# Altium project GTV4.0_Board.PrjPcb (part 5 of 11)

## Sheet Onboard_Sensor_Section.SchDoc
size 420 x 297 mm; DocumentNumber: 17; SheetNumber: 17; SheetTotal: 17
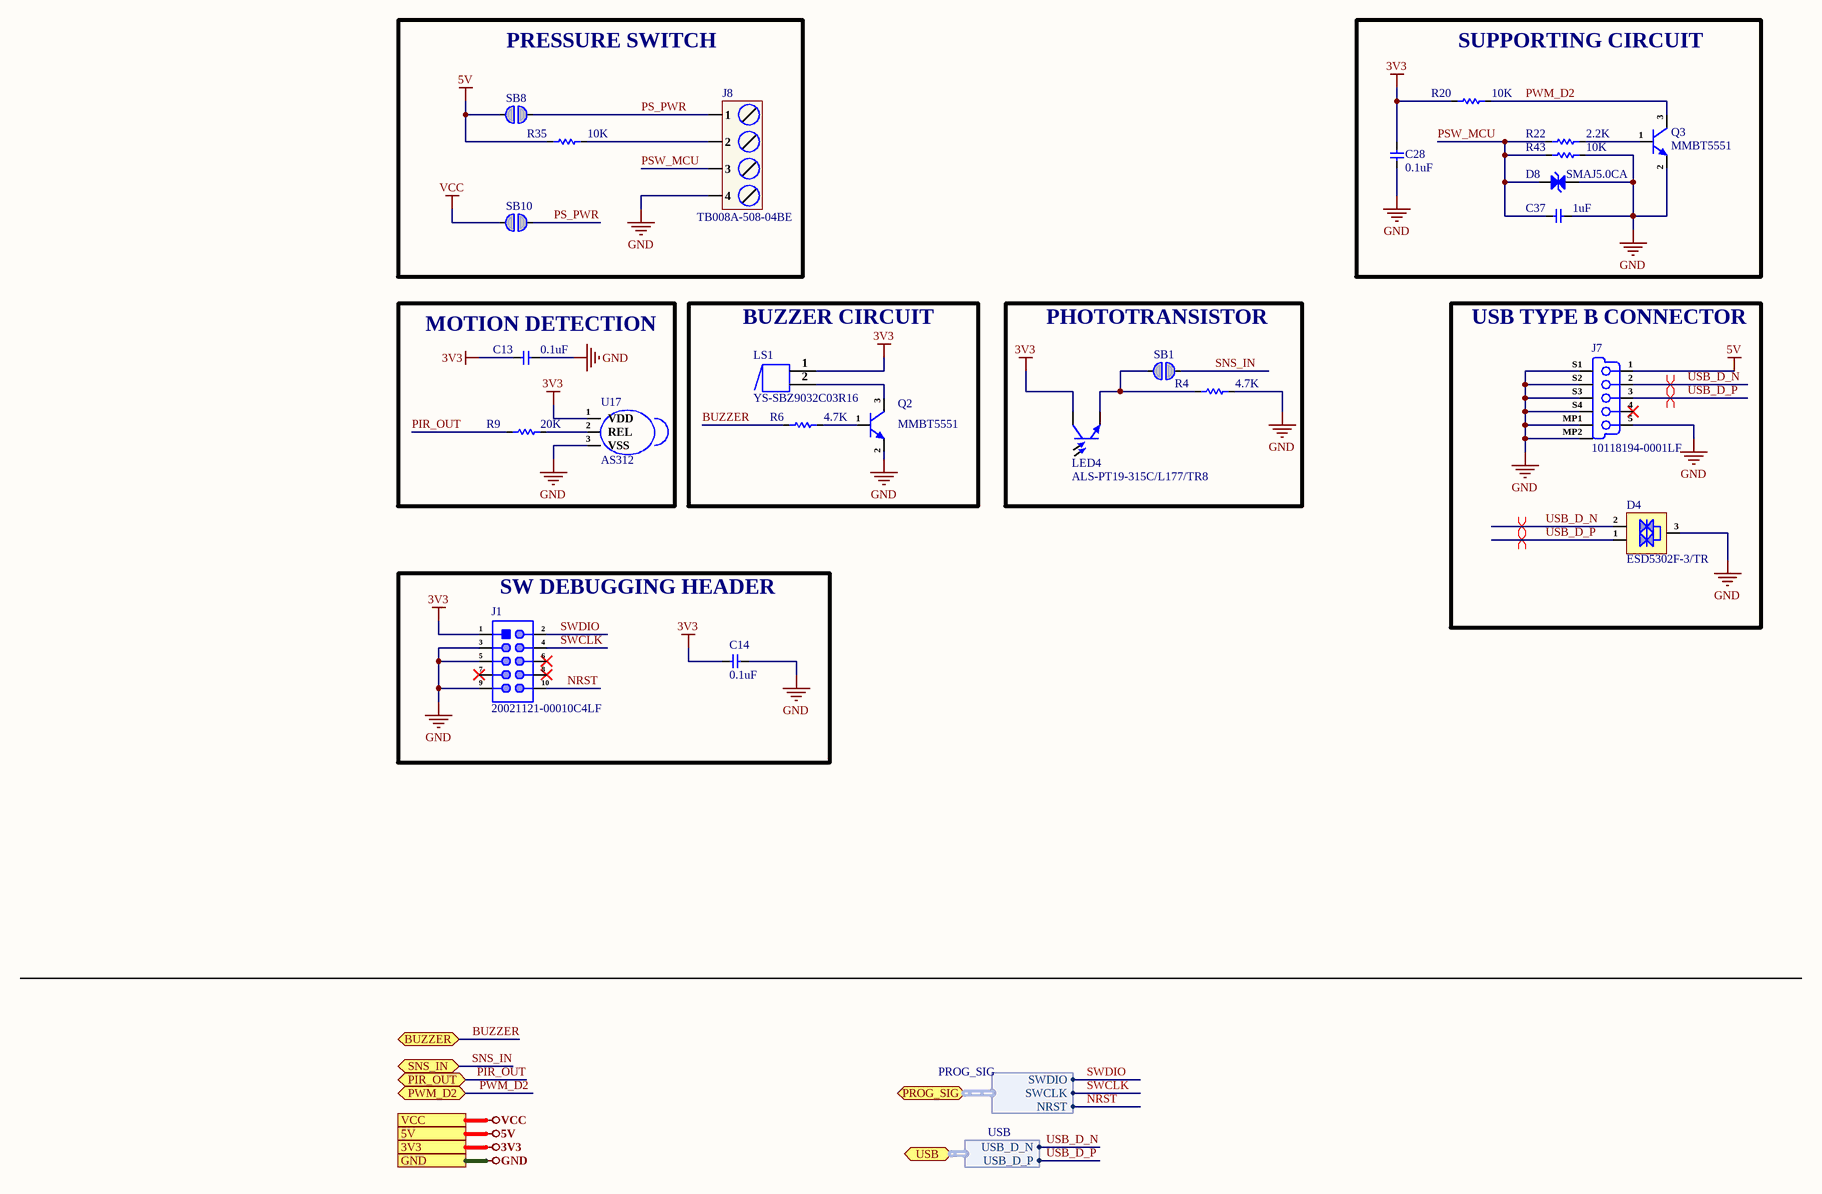
[diagram p7: Onboard_Sensor_Section.SchDoc]

### Parts
C13  0.1uF  [Cap-0603]
C14  0.1uF  [Cap-0603]
C28  0.1uF  [Cap-0603]
C37  1uF  [Cap-0603]
D4  ESD5302F-3/TR  [Sot-23]
D8  SMAJ5.0CA  [SMA Bi Directional]
J1  20021121-00010C4LF  [20021121-00010C4LF_]
J7  10118194-0001LF  [10118194-0001LF_]
J8  TB008A-508-04BE  [TB008A-508-04BE]
LED4  ALS-PT19-315C/L177/TR8  [ALS-PT19-315C/L177/TR_]
LS1  YS-SBZ9032C03R16  [YS-SBZ9032C03R16_]
Q2  MMBT5551  [SOT-23]
Q3  MMBT5551  [SOT-23]
R4  4.7K  [Res-0603]
R6  4.7K  [Res-0603]
R9  20K  [Res-0603]
R20  10K  [Res-0603]
R22  2.2K  [Res-0603]
R35  10K  [Res-0603]
R43  10K  [Res-0603]
SB1  Solder Bridge 0603  [Solder Bridge]  (value not drawn)  (no BOM)
SB8  Solder Bridge 0603  [Solder Bridge]  (value not drawn)  (no BOM)
SB10  Solder Bridge 0603  [Solder Bridge]  (value not drawn)  (no BOM)
U17  AS312  [AS312]

### Blocks framed on the sheet
PRESSURE SWITCH: J8 R35 SB8 SB10
SUPPORTING CIRCUIT: C28 C37 D8 Q3 R20 R22 R43
MOTION DETECTION: C13 R9 U17
BUZZER CIRCUIT: LS1 Q2 R6
PHOTOTRANSISTOR: LED4 R4 SB1
USB TYPE B CONNECTOR: D4 J7
SW DEBUGGING HEADER: C14 J1

### Ports
3V3, 5V, BUZZER (bidir), GND, PIR_OUT (bidir), PROG_SIG (bidir, harness PROG_SIG), PWM_D2 (bidir), SNS_IN (bidir), USB (bidir, harness USB), VCC

### Harnesses
PROG_SIG: SWDIO, SWCLK, NRST
USB: USB_D_N, USB_D_P

### Nets
3V3: C13.1 C14.1 C28.2 J1.1 LED4.1(C) LS1.1 R20.1 U17.1(VDD) ; port 3V3
5V: J7.1(V_BUS_(5V)) R35.1 SB8.2 ; port 5V
GND: C13.2 C14.2 C28.1 C37.2 D4.3(GND) D8.2(K) J1.3 J1.5 J1.9 J7.5(GND) J7.MP1(Tab) J7.MP2(Tab) J7.S1(Shield) J7.S2(Shield) J7.S3(Shield) J7.S4(Shield) J8.4 Q2.2(E) Q3.2(E) R4.2 R43.2 U17.3(VSS) ; port GND
VCC: SB10.2 ; port VCC
BUZZER: R6.1 ; port BUZZER
NRST: J1.10 ; port PROG_SIG.NRST
PIR_OUT: R9.1 ; port PIR_OUT
PS_PWR: J8.1 SB8.1 SB10.1
PSW_MCU: C37.1 D8.1(A) J8.3 R22.1 R43.1
PWM_D2: Q3.3(C) R20.2 ; port PWM_D2
SNS_IN: SB1.1 ; port SNS_IN
SWCLK: J1.4 ; port PROG_SIG.SWCLK
SWDIO: J1.2 ; port PROG_SIG.SWDIO
USB_D_N: D4.2(I/O2) J7.2(D-) ; port USB.USB_D_N
USB_D_P: D4.1(I/O1) J7.3(D+) ; port USB.USB_D_P
NetJ8_2: J8.2 R35.2
NetLED4_2: LED4.2(E) R4.1 SB1.2
NetLS1_2: LS1.2 Q2.3(C)
NetQ2_1: Q2.1(B) R6.2
NetQ3_1: Q3.1(B) R22.2
NetR9_2: R9.2 U17.2(REL)

Not connected (* = marked no-connect by the designer): J1 6* 7* 8*; J7 4(NC)*

### Layout directives
differential pair; differential pair class USB_D_Lines; net class USB_D; rule Matched Net Lengths [Tolerance = 50mil]; rule Impedance Constraint [Min = 85.00    Max = 90.00    ]: USB_D_N, USB_D_P

### Notes on the sheet
- File:
- Title:
- Date:
- Page
- Num:
- Total:
- Drawn By: Huzaifa Ali

### Library data of the parts
C13 C14 C28 = CC0603ZRY5V9BB104: as C6 on sheet Current_Sense_Section; Supplier 1: Digi-Key; Manufacturer Part Number: CC0603ZRY5V9BB104; Stock 1: 15000880; Pricing 1: 1=0.1, 10=0.075, 100=0.0334, 500=0.02386, 1000=0.01874 (USD); Mount: Surface Mount; Case/Package: 0603; Number of Pins: 2; Case Code (Metric): 1608; Case Code (Imperial): 0603; Min Operating Temperature: -30°C; Max Operating Temperature: 85°C; Dielectric: Y5V; Voltage Rating: 50V; Package Quantity: 1; Packaging: Tape and Reel; Voltage Rating (DC): 50V; Termination: SMD/SMT; Composition: Ceramic; Voltage: 50V; Length: 1.6mm; Height: 0.8mm; Width: 0.031inch; Thickness: 0.035inch; Depth: 0.8mm; Radiation Hardening: No; REACH SVHC: No SVHC; Lead Free: Lead Free; Halogen Free: Halogen Free; ComponentLink1URL: http://www.yageo.com/documents/recent/UPY-GPHC_Y5V_6.3V-to-50V_8.pdf?src-supplier=Digi-Key; ComponentLink1Description: http://www.yageo.com/documents/recent/UPY-GPHC_Y5V_6.3V-to-50V_8.pdf?src-supplier=Digi-Key; ComponentLink2URL: http://www.yageo.com/documents/recent/UPY-GPHC_Y5V_6.3V-to-50V_5.pdf?src-supplier=Avnet+Europe; ComponentLink2Description: http://www.yageo.com/documents/recent/UPY-GPHC_Y5V_6.3V-to-50V_5.pdf?src-supplier=Avnet+Europe; ComponentLink3URL: https://www.verical.com/server-webapp/html/getDatasheet?partID=403611&src-supplier=Verical; ComponentLink3Description: https://www.verical.com/server-webapp/html/getDatasheet?partID=403611&src-supplier=Verical; ComponentLink4URL: http://www.mouser.com/ds/2/447/Yageo_UPY-GP_NP0_16V-to-50V_9-358835.pdf?src-supplier=Mouser; ComponentLink4Description: http://www.mouser.com/ds/2/447/Yageo_UPY-GP_NP0_16V-to-50V_9-358835.pdf?src-supplier=Mouser; ComponentLink5URL: http://www.farnell.com/datasheets/1132289.pdf?src-supplier=Element14; ComponentLink5Description: http://www.farnell.com/datasheets/1132289.pdf?src-supplier=Element14; Supplier Part Number 1: 311-1343-1-ND; LCSC Part Number: C106221
C37 = CC0603KRX5R8BB105: as C117 on sheet Regulator_Section; Supplier 1: Digi-Key; Manufacturer Part Number: CC0603KRX5R8BB105; RoHS: Yes; Category: Ceramic Capacitors; Stock 1: 919939; Pricing 1: 1=0.12000, 10=0.08400, 50=0.04760, 100=0.03940, 500=0.02764, 1000=0.02288 (USD); Mount: Surface Mount; Case/Package: 0603; Number of Pins: 2; Case Code (Metric): 1608; Case Code (Imperial): 0603; Min Operating Temperature: -55°C; Max Operating Temperature: 85°C; Capacitance: 1uF; Dielectric: X5R; Package Quantity: 1; Voltage Rating: 25V; Packaging: Tape and Reel; Termination: SMD/SMT; Voltage Rating (DC): 25V; Series: CC; Construction: Flat; Length: 1.6mm; Width: 0.031inch; Height: 0.8mm; Thickness: 0.035inch; Depth: 0.8mm; Radiation Hardening: No; REACH SVHC: No SVHC; Lead Free: Lead Free; Halogen Free: Halogen Free; RoHS Compliant: Yes; ComponentLink1URL: https://datasheet.ciiva.com/176/mlccorderingcode-176785.pdf?src-supplier=Digi-Key; ComponentLink1Description: https://datasheet.ciiva.com/176/mlccorderingcode-176785.pdf?src-supplier=Digi-Key; ComponentLink2URL: https://datasheet.ciiva.com/176/mlccorderingcode-176786.pdf?src-supplier=Digi-Key; ComponentLink2Description: https://datasheet.ciiva.com/176/mlccorderingcode-176786.pdf?src-supplier=Digi-Key; ComponentLink3URL: https://datasheet.ciiva.com/176/mlccorderingcode-176787.pdf?src-supplier=Digi-Key; ComponentLink3Description: https://datasheet.ciiva.com/176/mlccorderingcode-176787.pdf?src-supplier=Digi-Key; ComponentLink4URL: https://datasheet.ciiva.com/17436/upy-gphc-x5r-4v-to-50v-12-17436952.pdf?src-supplier=Avnet+Europe; ComponentLink4Description: https://datasheet.ciiva.com/17436/upy-gphc-x5r-4v-to-50v-12-17436952.pdf?src-supplier=Avnet+Europe; ComponentLink5URL: https://datasheet.ciiva.com/7978/1525783-7978171.pdf?src-supplier=Element14; ComponentLink5Description: https://datasheet.ciiva.com/7978/1525783-7978171.pdf?src-supplier=Element14; ComponentLink6URL: https://datasheet.ciiva.com/11586/upy-gphc-x5r-4v-to-50v-12-11586318.pdf?src-supplier=Avnet; ComponentLink6Description: https://datasheet.ciiva.com/11586/upy-gphc-x5r-4v-to-50v-12-11586318.pdf?src-supplier=Avnet; Supplier Part Number 1: 311-1445-1-ND; LCSC Part Number: C14664
D4 = ESD5302F-3/TR: 16A 20V 7V 5V@Max Unidirectional SOT-23 TVS ROHS; Manufacturer: WILLSEMI; Item Type: Diode; Manufacturer Part Number: ESD5302F-3/TR; Package: SOT-23; LCSC Part Number: C239643; ComponentLink1Description: LCSC; ComponentLink1URL: https://www.lcsc.com/product-detail/TVS_WILLSEMI-Will-Semicon-ESD5302F-3-TR_C239643.html
D8 = SMAJ5.0CA: TVS DIODE 5VWM 9.2VC SMA; Manufacturer: FTR; Manufacturer Part Number: SMAJ5.0CA; Package: SMA(DO-214AC); Item Type: Diode; LCSC Part Number: C693487; ComponentLink1Description: LCSC; ComponentLink1URL: https://www.lcsc.com/product-detail/TVS_GOODWORK-SMAJ5-0CA_C908809.html
J1 = 20021121-00010C4LF: CONN HEADER SMD 10POS 1.27MM; Manufacturer: Amphenol FCI; Number of Contacts: 10; Contact Resistance: 30mR; Current Rating: 1A; Voltage Rating: 125V; Insulation Resistance: 100MR; Gender: Male; Connector Type: Male Pin,Header; Row Spacing: 0.05inch; Stack Height: 3mm; Item Type: Jtag Male Header; Supplier 1: Digi-Key; Manufacturer Part Number: 20021121-00010C4LF; Stock 1: 0; Pricing 1: 1=0.87, 10=0.761, 100=0.6563 (USD); Mount: Surface Mount; Contact Plating: Gold; Contact Material: Copper Alloy,Copper,Gold; Color: Black; Housing Color: Black; Housing Material: Thermoplastic; Min Operating Temperature: -40°C; Max Operating Temperature: 85°C; Number of Rows: 2; Termination: Solder; Packaging: Tape and Reel; Package Quantity: 600; Number of Positions: 10; Max Voltage Rating (AC): 125V; Orientation: Straight; Length: 6.35mm; Pitch: 1.27mm; Contact Mating Length: 0.12inch; Depth: 3.4mm; Radiation Hardening: No; REACH SVHC: No SVHC; ComponentLink1URL: https://www.verical.com/server-webapp/html/getDatasheet?partID=177140&src-supplier=Verical; ComponentLink1Description: https://www.verical.com/server-webapp/html/getDatasheet?partID=177140&src-supplier=Verical; ComponentLink2URL: http://portal.fciconnect.com/Comergent/fci/drawing/20021121.pdf?src-supplier=Avnet; ComponentLink2Description: http://portal.fciconnect.com/Comergent/fci/drawing/20021121.pdf?src-supplier=Avnet; ComponentLink3URL: https://cdn.amphenol-icc.com/media/wysiwyg/files/drawing/20021121.pdf?src-supplier=Digi-Key; ComponentLink3Description: https://cdn.amphenol-icc.com/media/wysiwyg/files/drawing/20021121.pdf?src-supplier=Digi-Key; ComponentLink4URL: http://portal.fciconnect.com/Comergent/fci/drawing/20021121.pdf?src-supplier=Avnet+Europe; ComponentLink4Description: http://portal.fciconnect.com/Comergent/fci/drawing/20021121.pdf?src-supplier=Avnet+Europe; ComponentLink5URL: https://media.digikey.com/pdf/Data%20Sheets/FCI%20PDFs/Minitek%20127_Catalog.pdf?src-supplier=Digi-Key; ComponentLink5Description: https://media.digikey.com/pdf/Data%20Sheets/FCI%20PDFs/Minitek%20127_Catalog.pdf?src-supplier=Digi-Key; ComponentLink6URL: http://portal.fciconnect.com/Comergent//fci/drawing/20021121.pdf?src-supplier=Mouser; ComponentLink6Description: http://portal.fciconnect.com/Comergent//fci/drawing/20021121.pdf?src-supplier=Mouser; Supplier Part Number 1: 609-3695-6-ND; LCSC Part Number: C150517
J7 = 10118194-0001LF: CONN RCPT USB2.0 MICRO B SMD R/A; Manufacturer: Amphenol FCI; Gender: Receptacle; Current Rating: 1.8A; Connector Type: USB,Receptacle; Number of Contacts: 5; Insulation Resistance: 1GR; Number of Ports: 1; Max Voltage Rating (AC): 100V; Pitch: 0.65mm; Item Type: USB B Connector; Supplier 1: Digi-Key; Manufacturer Part Number: 10118194-0001LF; Stock 1: 35943; Pricing 1: 1=0.43, 10=0.405, 25=0.3648, 50=0.3242, 100=0.3107, 250=0.28368, 500=0.27016 (USD); Mount: Surface Mount,Horizontal; Color: Black; Contact Material: Copper Alloy; Contact Plating: Gold; Number of Terminals: 5; Housing Material: Polymer; Min Operating Temperature: -55°C; Max Operating Temperature: 85°C; Package Quantity: 9600; Packaging: Tape and Reel; Termination: Solder; Orientation: Right Angle; Features: Shielded; Length: 8.05mm; Depth: 5mm; Radiation Hardening: No; Lead Free: Lead Free; Flammability Rating: UL94 V-0; ComponentLink1URL: http://www.amphenol-icc.com/media/wysiwyg/files/drawing/10118194.pdf?src-supplier=Digi-Key; ComponentLink1Description: http://www.amphenol-icc.com/media/wysiwyg/files/drawing/10118194.pdf?src-supplier=Digi-Key; ComponentLink2URL: https://cdn.amphenol-icc.com/media/wysiwyg/files/drawing/10118194.pdf?src-supplier=Mouser; ComponentLink2Description: https://cdn.amphenol-icc.com/media/wysiwyg/files/drawing/10118194.pdf?src-supplier=Mouser; ComponentLink3URL: https://cdn.amphenol-icc.com/media/wysiwyg/files/drawing/10118194.pdf?src-supplier=Verical; ComponentLink3Description: https://cdn.amphenol-icc.com/media/wysiwyg/files/drawing/10118194.pdf?src-supplier=Verical; Supplier Part Number 1: 609-4618-1-ND; LCSC Part Number: C132563
J8 = TB008A-508-04BE: TERMINAL BLOCK, SCREW TYPE, 5.08; Manufacturer: Same Sky; Item Type: Terminal Blocks; Approvals: CE, IEC, UL, cUL; Current Rating: 16A; Number of Contacts: 4; Number of Levels: 1; Pitch: 5.08mm; Voltage Rating: 300V; Wire/Cable Gauge: 12AWG; Supplier: DigiKey; Supplier Part Number: 102-6215-ND; Manufacturer Part Number: TB008A-508-04BE; RoHS: Compliant; Stock: 5628; Pricing: 1=1.14, 10=0.833, 25=0.7248, 50=0.654, 100=0.5931, 250=0.52748, 600=0.47917, 1200=0.4494, 5400=0.40466 (USD); Color: Blue; Height: 15.82mm; Lifecycle Status: Production; Max Operating Temperature: 105°C; Min Operating Temperature: -40°C; Mounting Technology: Screw; Number of Rows: 1; Width: 13.89mm; ComponentLink1URL: https://datasheet.octopart.com:443/TB008A-508-04BE-Same-Sky-datasheet-181920260.pdf?src-supplier=Same+Sky; ComponentLink1Description: https://datasheet.octopart.com:443/TB008A-508-04BE-Same-Sky-datasheet-181920260.pdf?src-supplier=Same+Sky; ComponentLink2URL: https://datasheet.octopart.com:443/TB008A-508-04BE-CUI-Devices-datasheet-175928141.pdf?src-supplier=Same+Sky; ComponentLink2Description: https://datasheet.octopart.com:443/TB008A-508-04BE-CUI-Devices-datasheet-175928141.pdf?src-supplier=Same+Sky; ComponentLink3URL: https://datasheet.octopart.com:443/TB008A-508-04BE-CUI-Devices-datasheet-144794964.pdf?src-supplier=Same+Sky; ComponentLink3Description: https://datasheet.octopart.com:443/TB008A-508-04BE-CUI-Devices-datasheet-144794964.pdf?src-supplier=Same+Sky; ComponentLink4URL: https://datasheet.octopart.com:443/TB008A-508-04BE-CUI-Devices-datasheet-180438533.pdf?src-supplier=IHS; ComponentLink4Description: https://datasheet.octopart.com:443/TB008A-508-04BE-CUI-Devices-datasheet-180438533.pdf?src-supplier=IHS; ComponentLink5URL: https://datasheet.octopart.com:443/TB008A-508-04BE-Same-Sky-datasheet-182881448.pdf?src-supplier=Electro+Sonic; ComponentLink5Description: https://datasheet.octopart.com:443/TB008A-508-04BE-Same-Sky-datasheet-182881448.pdf?src-supplier=Electro+Sonic; ComponentLink6URL: https://datasheet.octopart.com:443/TB008A-508-04BE-CUI-Devices-datasheet-175927974.pdf?src-supplier=CUI+Devices+SCT; ComponentLink6Description: https://datasheet.octopart.com:443/TB008A-508-04BE-CUI-Devices-datasheet-175927974.pdf?src-supplier=CUI+Devices+SCT; ComponentLink7URL: https://datasheet.octopart.com:443/TB008A-508-04BE-CUI-Devices-datasheet-142371924.pdf?src-supplier=CUI+Devices+SCT; ComponentLink7Description: https://datasheet.octopart.com:443/TB008A-508-04BE-CUI-Devices-datasheet-142371924.pdf?src-supplier=CUI+Devices+SCT; ComponentLink8URL: https://octopart.com:443/opatz8j6/c1?t=hGvcwVFCluaof_F_xfzySJZeS5TbXVjbvjBRKQv-3irzXUzCEiOoxviMhdjRwAb3fOCDVe4c5YGr-0WW8XN3cEfZX5wGS5TsQt0_PkryWK4ovLFNv0kxfacWAuW0ZsoLC1d8PZGzL_RujTsCFKJeixsWFtvWnZHquXYDPWSaMEm2NajHA6hQYmAL5oH5NE5VbXDgyJFupMAl_60Y4gU8_zMBRTNtepsp_uCzaYBmldgpjRQcz_FrhdxgGRUVVYU-GQCk8GR1JA5LP3N_h8JcKCEohvKWuFQD1_k5TrYcqod8vt8FhZbO_j5MOoXA-2FHSBOKuQiqNs835mRvEd7KXZ8_SSnD6XzLcd8eVf8XSQ&src-supplier=Compliance+Statements; ComponentLink8Description: https://octopart.com:443/opatz8j6/c1?t=hGvcwVFCluaof_F_xfzySJZeS5TbXVjbvjBRKQv-3irzXUzCEiOoxviMhdjRwAb3fOCDVe4c5YGr-0WW8XN3cEfZX5wGS5TsQt0_PkryWK4ovLFNv0kxfacWAuW0ZsoLC1d8PZGzL_RujTsCFKJeixsWFtvWnZHquXYDPWSaMEm2NajHA6hQYmAL5oH5NE5VbXDgyJFupMAl_60Y4gU8_zMBRTNtepsp_uCzaYBmldgpjRQcz_FrhdxgGRUVVYU-GQCk8GR1JA5LP3N_h8JcKCEohvKWuFQD1_k5TrYcqod8vt8FhZbO_j5MOoXA-2FHSBOKuQiqNs835mRvEd7KXZ8_SSnD6XzLcd8eVf8XSQ&src-supplier=Compliance+Statements; ComponentLink9URL: https://octopart.com:443/opatz8j6/c1?t=kcSyPpMU4RMF4VpwiQE-vJl8CamqtVbKkLklcOULTBNIjlJlIxbT5UVKofOl15FhQc6Ivmv9LIPZHTHBsEbapZqtFFdTEXS3BvBw3lR-XVowoaKLmyENkRQxW_qAoJFYG0K2AtNOfH4fQoDAbATgRkt9CS-AoJvNW7hVQcq3p1vqSemKtdokDR8cAxYex92iO8_Mk2rTIvg6a28-X5kEZlUiTVepfc-9M2XGm2vN09cF4Wboki8fsU05tXaelQ0ZNRPnjS-McBzlof2dcZyflBQCVo1dNw8uQ3VjkX7PyeDYMoTtW7hf0jd0vfOVEoP87q9SuMHxGCuHptUdsndpROH7GdXMoN4B7g9EMxMunBUwuk4&src-supplier=Compliance+Statements; ComponentLink9Description: https://octopart.com:443/opatz8j6/c1?t=kcSyPpMU4RMF4VpwiQE-vJl8CamqtVbKkLklcOULTBNIjlJlIxbT5UVKofOl15FhQc6Ivmv9LIPZHTHBsEbapZqtFFdTEXS3BvBw3lR-XVowoaKLmyENkRQxW_qAoJFYG0K2AtNOfH4fQoDAbATgRkt9CS-AoJvNW7hVQcq3p1vqSemKtdokDR8cAxYex92iO8_Mk2rTIvg6a28-X5kEZlUiTVepfc-9M2XGm2vN09cF4Wboki8fsU05tXaelQ0ZNRPnjS-McBzlof2dcZyflBQCVo1dNw8uQ3VjkX7PyeDYMoTtW7hf0jd0vfOVEoP87q9SuMHxGCuHptUdsndpROH7GdXMoN4B7g9EMxMunBUwuk4&src-supplier=Compliance+Statements; ComponentLink10URL: https://octopart.com:443/opatz8j6/c1?t=l6hRGZkTByDfJKP0wjoChujQdUe10jMusc-_a500HSGKN_CBApmvAkO6R9Z66QIZAkxJwrS_e77arXYN0D4KMAQY6kf5trjTt7cbNbXdJ19-jX2xdgBJNHgQ5piJwMQy0j1cjvOnscxRAEVTRujX-MIpC9afUxDNR6j8ZshfBKCtAhxZsuMdKJaRyfNFgz62X5UOXHxW2F9FO61bSliYNKc_gyYtpwMs8OBLVBvRIN39Pxv0hFbPaaBzQoOyZmcaapE2_AliUpkUpVlcqFwL0AIe6zxyatQvYXWCrfe_hkJarxpJgGXX8YhKbFMoTHVKEjQfhWh6dOEaufH6As1HmOljMZjV1NUMWRYwWsY_3w&src-supplier=Compliance+Statements; ComponentLink10Description: https://octopart.com:443/opatz8j6/c1?t=l6hRGZkTByDfJKP0wjoChujQdUe10jMusc-_a500HSGKN_CBApmvAkO6R9Z66QIZAkxJwrS_e77arXYN0D4KMAQY6kf5trjTt7cbNbXdJ19-jX2xdgBJNHgQ5piJwMQy0j1cjvOnscxRAEVTRujX-MIpC9afUxDNR6j8ZshfBKCtAhxZsuMdKJaRyfNFgz62X5UOXHxW2F9FO61bSliYNKc_gyYtpwMs8OBLVBvRIN39Pxv0hFbPaaBzQoOyZmcaapE2_AliUpkUpVlcqFwL0AIe6zxyatQvYXWCrfe_hkJarxpJgGXX8YhKbFMoTHVKEjQfhWh6dOEaufH6As1HmOljMZjV1NUMWRYwWsY_3w&src-supplier=Compliance+Statements; ComponentLink11URL: https://octopart.com:443/opatz8j6/c1?t=GIq7aDdChJgHFYgeLx6bK2fnpsa8yHt5NBD6UzpxNhj-JGjs7cwjJzyJXx8qUNkt4CyAB53dWU77ZJb9LS3HFvWpfMUSXGIsO1beyBdTid9q8slGEYu7IBIewf0GnxynNkDOZXgKYLk3NKuccprZ30RSHLrF0NVQza7GgcHR9xha1J9gFkNwhZbFB7CZZEh_u0FYvLWhSGSW0KKMrlJv3yGYqQGUZplbJUXnuDQHhDQeYzl7ZWMt3PZlLfjF-dG7gJAcYTZln9WiR7fcYTm6nTF1klQUs_EhcdgQ3j1iRrIGJdpONymccdurqN94YjpYwxiqo2CenTd-fgklSWPjb5fiprlTST3oZF7xVWcdLvwV1ek&src-supplier=Compliance+Statements; ComponentLink11Description: https://octopart.com:443/opatz8j6/c1?t=GIq7aDdChJgHFYgeLx6bK2fnpsa8yHt5NBD6UzpxNhj-JGjs7cwjJzyJXx8qUNkt4CyAB53dWU77ZJb9LS3HFvWpfMUSXGIsO1beyBdTid9q8slGEYu7IBIewf0GnxynNkDOZXgKYLk3NKuccprZ30RSHLrF0NVQza7GgcHR9xha1J9gFkNwhZbFB7CZZEh_u0FYvLWhSGSW0KKMrlJv3yGYqQGUZplbJUXnuDQHhDQeYzl7ZWMt3PZlLfjF-dG7gJAcYTZln9WiR7fcYTm6nTF1klQUs_EhcdgQ3j1iRrIGJdpONymccdurqN94YjpYwxiqo2CenTd-fgklSWPjb5fiprlTST3oZF7xVWcdLvwV1ek&src-supplier=Compliance+Statements
LED4 = ALS-PT19-315C/L177/TR8: SENSOR PHOTO 630NM 2SMD; Manufacturer: Everlight; Rise Time: 0.11ms; Fall Time: 0.22ms; Lens Style: Flat; Collector Emitter Breakdown Voltage: 5.5V; Polarity: NPN; Number of Elements: 1; Dark Current: 100nA; Item Type: Photo Sensor; Supplier 1: Digi-Key; Manufacturer Part Number: ALS-PT19-315C/L177/TR8; RoHS: Yes; Category: Sensors; Stock 1: 41849; Pricing 1: 1=0.46000, 5=0.41800, 10=0.37100, 25=0.33200, 50=0.29180, 100=0.24880, 500=0.20576, 1000=0.17226 (USD); Mount: Surface Mount; Case/Package: SMD/SMT; Number of Pins: 2; Min Operating Temperature: -40°C; Max Operating Temperature: 85°C; Wavelength: 630nm; Packaging: Tape and Reel; Package Quantity: 1; Max Breakdown Voltage: 5.5V; Radiation Hardening: No; RoHS Compliant: Yes; ComponentLink1URL: https://datasheet.ciiva.com/12092/als-pt19-315c-l177-tr-datasheet-34741-12092024.pdf?src-supplier=Mouser; ComponentLink1Description: https://datasheet.ciiva.com/12092/als-pt19-315c-l177-tr-datasheet-34741-12092024.pdf?src-supplier=Mouser; ComponentLink2URL: https://datasheet.ciiva.com/4270/alspt19315cl177-tr8-1810-4270796.pdf?src-supplier=Arrow+Electronics; ComponentLink2Description: https://datasheet.ciiva.com/4270/alspt19315cl177-tr8-1810-4270796.pdf?src-supplier=Arrow+Electronics; Supplier Part Number 1: 1080-1244-1-ND; LCSC Part Number: C146233
LS1 = YS-SBZ9032C03R16: Externally Driven 85dB@3V,10cm 3V 2700Hz SMD,D=9mm Buzzers ROHS; Manufacturer: Fengming; Item Type: Buzzer; Manufacturer Part Number: YS-SBZ9032C03R16; Package: SMD,D=9mm; LCSC Part Number: C409828; ComponentLink1Description: LCSC; ComponentLink1URL: https://www.lcsc.com/product-detail/Buzzers_Fengming-YS-SBZ9032C03R16_C409828.html
Q2 Q3 = MMBT5551: TRANS NPN 160V 0.6A SOT-23; Manufacturer: ON Semiconductor; Manufacturer Part Number: MMBT5551LT1G; Max Power Dissipation: 225mW; Max Collector Current: 600mA; Collector Base Voltage (VCBO): 180V; Emitter Base Voltage (VEBO): 6V; Element Configuration: Single; hFE Min: 80; Power Dissipation: 300mW; Number of Elements: 1; Collector Emitter Saturation Voltage: 150mV; Collector-emitter Voltage-Max: 200mV; Item Type: Transister; Supplier 1: Digi-Key; RoHS: Yes; Category: BJTs; Pricing 1: 1=0.22000, 10=0.17700, 100=0.09370, 500=0.06162, 1000=0.04190 (USD); Case/Package: SOT-23-3; Number of Pins: 3; Weight: 0.01lb; Contact Plating: Tin,Matte; Min Operating Temperature: -55°C; Max Operating Temperature: 150°C; Packaging: Tape and Reel; Collector Emitter Voltage (VCEO): 160V; Polarity: NPN; Package Quantity: 1; Collector Emitter Breakdown Voltage: 160V; Current Rating: 600mA; Voltage Rating (DC): 160V; Max Breakdown Voltage: 160V; Series: -; Length: 2.9mm; Width: 1.3mm; Height: 0.94mm; Radiation Hardening: No; Lead Free: Lead Free; REACH SVHC: No SVHC; RoHS Compliant: Yes; Supplier Part Number 1: MMBT5551LT1GOSDKR-ND; LCSC Part Number: C909756; ComponentLink14Description: LCSC; ComponentLink14URL: https://www.lcsc.com/product-detail/Bipolar-Transistors-BJT_Jiangsu-Changjing-Electronics-Technology-Co-Ltd-MMBT5551_C2145.html
R4 R6 = RC0603FR-074K7L: RES SMD 4.7K OHM 1% 1/10W 0603; Manufacturer: Yageo; Item Type: Resistor; Manufacturer Part Number: RC0603FR-074K7L; Package: 0603; ComponentLink7Description: LCSC; ComponentLink7URL: https://www.lcsc.com/product-detail/Chip-Resistor-Surface-Mount_YAGEO-RC0603FR-074K7L_C99782.html; LCSC Part Number: C99782
R9 = RC0603FR-0720KL: as R163 on sheet Regulator_Section; Supplier 1: Arrow Electronics; Manufacturer Part Number: RC0603FR-0720KL; RoHS: Yes; Category: Chip SMD Resistors; Stock 1: 945000; Pricing 1: 5000=0.00240, 10000=0.00220, 25000=0.00200, 50000=0.00190, 125000=0.00180 (USD); Case/Package: 0603; Number of Pins: 2; Case Code (Imperial): 0603; Case Code (Metric): 1608; Size Code: 0603; Min Operating Temperature: -55°C; Max Operating Temperature: 155°C; Tolerance: 1%; Packaging: Tape and Reel; Resistor Type: Thick Film; Voltage Rating: 50V; Package Quantity: 1; Termination: SMD/SMT; Number of Terminations: 2; Max Power Dissipation: 100mW; Features: Moisture Resistant; Series: RC; Technology: THICK FILM; Construction: Rectangular; Resistance Tolerance: 1%; Length: 0.063inch; Width: 0.031inch; Height: 0.022inch; Depth: 0.8mm; Lead Free: Lead Free; RoHS Compliant: Yes; REACH SVHC: No SVHC; Military Standard: Not; ComponentLink1URL: https://datasheet.ciiva.com/11808/0900766b80f96399-11808275.pdf?src-supplier=RSComponents; ComponentLink1Description: https://datasheet.ciiva.com/11808/0900766b80f96399-11808275.pdf?src-supplier=RSComponents; ComponentLink2URL: https://datasheet.ciiva.com/22747/443971-22747525.pdf?src-supplier=Element14; ComponentLink2Description: https://datasheet.ciiva.com/22747/443971-22747525.pdf?src-supplier=Element14; ComponentLink3URL: https://datasheet.ciiva.com/2453/pyu-r-int-thick-7-2453911.pdf?src-supplier=Digi-Key; ComponentLink3Description: https://datasheet.ciiva.com/2453/pyu-r-int-thick-7-2453911.pdf?src-supplier=Digi-Key; ComponentLink4URL: https://datasheet.ciiva.com/2453/pyu-r-int-thick-7-2453912.pdf?src-supplier=Digi-Key; ComponentLink4Description: https://datasheet.ciiva.com/2453/pyu-r-int-thick-7-2453912.pdf?src-supplier=Digi-Key; ComponentLink5URL: https://datasheet.ciiva.com/2453/pyu-r-int-thick-7-2453910.pdf?src-supplier=Digi-Key; ComponentLink5Description: https://datasheet.ciiva.com/2453/pyu-r-int-thick-7-2453910.pdf?src-supplier=Digi-Key; Supplier Part Number 1: RC0603FR-0720KL; LCSC Part Number: C105575
R20 R35 R43 = RK73G1JTTD1002F: RES 10K OHM 1% 1/10W 0603; Item Type: Resistor; Value: 10kR; Power Rating: 100mW; Voltage Rating: 75V; Temperature Coefficient: 50ppm/°C; LCSC Part Number: C362180; ComponentLink1Description: LCSC; Supplier: Digi-Key; Supplier Part Number: 2019-RK73G1JTTD1002FCT-ND; RoHS: Yes; Category: Chip SMD Resistors; Stock: 249394; Pricing: 1=0.22, 10=0.118, 50=0.0812, 100=0.0699, 500=0.0513, 1000=0.04545 (USD); Case/Package: 0603; Case Code (Imperial): 0603; Case Code (Metric): 1608; Min Operating Temperature: -55°C; Max Operating Temperature: 125°C; Tolerance: 1%; Packaging: Tape and Reel; Termination: SMD/SMT; Series: RK73G; Construction: Rectangular; Length: 1.6mm; Depth: 0.8mm; Military Standard: Not; RoHS Compliant: Yes; ComponentLink2URL: http://www.mouser.com/ds/2/219/RK73G-9863.pdf?src-supplier=Mouser; ComponentLink2Description: http://www.mouser.com/ds/2/219/RK73G-9863.pdf?src-supplier=Mouser
R22 = RC0603FR-072K2L: RES 2.2K OHM 1% 1/10W 0603; Manufacturer: Yageo; Resistance: 2.2kR; Temperature Coefficient: 100ppm/°C; Power Rating: 100mW; Voltage Rating: 50V; Item Type: Resistor; Supplier 1: Avnet; Manufacturer Part Number: RC0603FR-072K2L; RoHS: Yes; Category: Chip SMD Resistors; Stock 1: 733100; Pricing 1: 5000=0.00133, 10000=0.00131, 20000=0.00127 (USD); Case/Package: 0603; Case Code (Imperial): 0603; Case Code (Metric): 1608; Size Code: 0603; Min Operating Temperature: -55°C; Max Operating Temperature: 155°C; Tolerance: 1%; Packaging: Tape and Reel; Resistor Type: Thick Film; Package Quantity: 1; Termination: SMD/SMT; Number of Terminations: 2; Max Power Dissipation: 100mW; Features: Moisture Resistant; Series: RC; Resistance Tolerance: 1%; Construction: Rectangular; Length: 1.6mm; Width: 0.031inch; Height: 0.022inch; Depth: 0.8mm; Lead Free: Lead Free; Military Standard: Not; RoHS Compliant: Yes; Supplier Part Number 1: RC0603FR-072K2L; LCSC Part Number: C114662
SB1 SB8 SB10 = Solder Bridge 0603: Solder Bridge ON; Manufacturer Part Number: Solder Bridge; Item Type: Solder Bridge
U17 = AS312: Plugin Human Body Sensing Sensor ROHS; Manufacturer: Senba Sensing Tech; Manufacturer Part Number: AS312; Package: Plugin; LCSC Part Number: C90465; Item Type: Sensor; ComponentLink1Description: LCSC; ComponentLink1URL: https://lcsc.com/product-detail/Biometric-Sensors_Senba-Sensing-Tech-AS312_C90465.html

## Sheet Receiver_Section.SchDoc
size 420 x 297 mm; DocumentNumber: 16; SheetNumber: 16; SheetTotal: 17
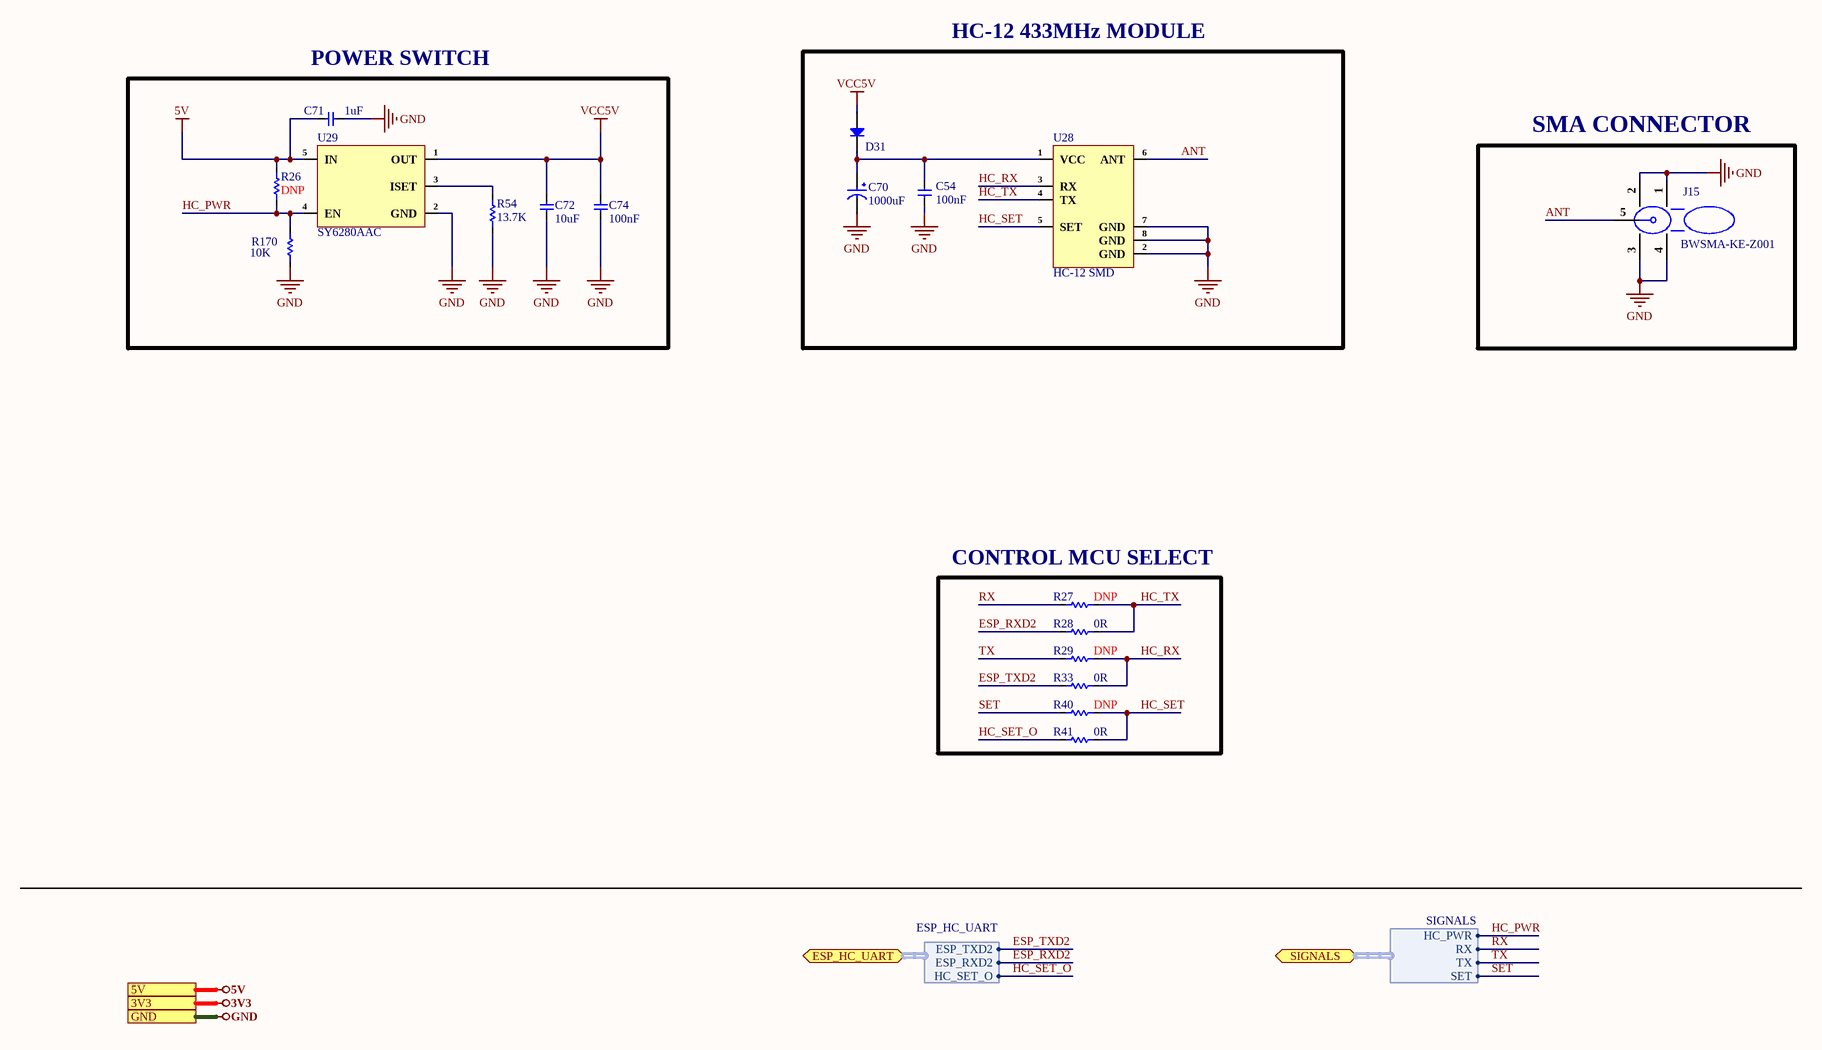
[diagram p8: Receiver_Section.SchDoc]

### Parts
C54  100nF  [Cap-0402]
C70  1000uF  [UUD1A102MNL1GS]
C71  1uF  [Cap-0402]
C72  10uF  [Cap-0603]
C74  100nF  [Cap-0402]
D31  1N4007- SMD  [SMA(DO-214AC)]  (value not drawn)
J15  BWSMA-KE-Z001  [BWSMA-KE-Z001]
R26  DNP  [Res-0402]
R27  DNP  [Res-0603]
R28  0R  [Res-0603]
R29  DNP  [Res-0603]
R33  0R  [Res-0603]
R40  DNP  [Res-0603]
R41  0R  [Res-0603]
R54  13.7K  [Res-0603]
R170  10K  [Res-0402]
U28  HC-12 SMD  [HC-12 Module SMD]
U29  SY6280AAC  [SOT-23-5]

### Blocks framed on the sheet
POWER SWITCH: C71 C72 C74 R26 R54 R170 U29
HC-12 433MHz MODULE: C54 C70 D31 U28
SMA CONNECTOR: J15
CONTROL MCU SELECT: R27-R29 R33 R40 R41

### Ports
3V3, 5V, ESP_HC_UART (bidir, harness ESP_HC_UART), GND, SIGNALS (bidir, harness SIGNALS)

### Harnesses
SIGNALS: RX, TX, SET, HC_PWR
ESP_HC_UART: ESP_TXD2, ESP_RXD2, HC_SET_O

### Nets
5V: C71.2 R26.2 U29.5(IN) ; port 5V
GND: C54.2 C70.2 C71.1 C72.1 C74.1 J15.1 J15.2 J15.3 J15.4 R54.1 R170.1 U28.2(GND) U28.7(GND) U28.8(GND) U29.2(GND) ; port GND
VCC5V: C72.2 C74.2 D31.2(A) U29.1(OUT)
ANT: J15.5 U28.6(ANT)
ESP_RXD2: R28.1 ; port ESP_HC_UART.ESP_RXD2
ESP_TXD2: R33.1 ; port ESP_HC_UART.ESP_TXD2
HC_PWR: R26.1 R170.2 U29.4(EN) ; port SIGNALS.HC_PWR
HC_RX: R29.2 R33.2 U28.3(RX)
HC_SET: R40.2 R41.2 U28.5(SET)
HC_SET_O: R41.1 ; port ESP_HC_UART.HC_SET_O
HC_TX: R27.2 R28.2 U28.4(TX)
RX: R27.1 ; port SIGNALS.RX
SET: R40.1 ; port SIGNALS.SET
TX: R29.1 ; port SIGNALS.TX
NetC54_1: C54.1 C70.1 D31.1(K) U28.1(VCC)
NetR54_2: R54.2 U29.3(ISET)

### Notes on the sheet
- File:
- Title:
- Date:
- Page
- Num:
- Total:
- Drawn By: Huzaifa Ali

### Library data of the parts
C54 C74 = CC0402KRX5R7BB104: CAP CER 0.1UF 16V X5R 0402; Manufacturer: Yageo; Tolerance: 10%; Supplier 1: Mouser; Manufacturer Part Number: CC0402KRX5R7BB104; Stock 1: 936792; Pricing 1: 1=0.10000, 10=0.02300, 50=0.02300, 100=0.01100, 1000=0.00600, 10000=0.00400 (USD); Mount: Surface Mount; Case/Package: 0402; Number of Pins: 2; Case Code (Metric): 1005; Case Code (Imperial): 0402; Min Operating Temperature: -55°C; Max Operating Temperature: 85°C; Capacitance: 100nF; Dielectric: X5R; Voltage Rating: 16V; Package Quantity: 1; Packaging: Tape and Reel; Voltage Rating (DC): 16V; Termination: SMD/SMT; Length: 1mm; Height: 0.5mm; Width: 0.02inch; Thickness: 0.022inch; Depth: 0.5mm; Radiation Hardening: No; REACH SVHC: Unknown; Lead Free: Lead Free; Halogen Free: Halogen Free; ComponentLink1URL: https://datasheet.ciiva.com/155/mlccorderingcode-155879.pdf?src-supplier=Digi-Key; ComponentLink1Description: https://datasheet.ciiva.com/155/mlccorderingcode-155879.pdf?src-supplier=Digi-Key; ComponentLink2URL: https://datasheet.ciiva.com/155/mlccorderingcode-155878.pdf?src-supplier=Digi-Key; ComponentLink2Description: https://datasheet.ciiva.com/155/mlccorderingcode-155878.pdf?src-supplier=Digi-Key; ComponentLink3URL: https://datasheet.ciiva.com/155/mlccorderingcode-155880.pdf?src-supplier=Digi-Key; ComponentLink3Description: https://datasheet.ciiva.com/155/mlccorderingcode-155880.pdf?src-supplier=Digi-Key; ComponentLink4URL: https://datasheet.ciiva.com/11464/upy-gphc-x5r-4v-to-50v-12-11464869.pdf?src-supplier=Avnet; ComponentLink4Description: https://datasheet.ciiva.com/11464/upy-gphc-x5r-4v-to-50v-12-11464869.pdf?src-supplier=Avnet; Supplier Part Number 1: 603-CC402KRX5R7BB104; RoHS: Yes; Category: Ceramic Capacitors; Resistor Type: Ceramic; Series: CC; Construction: Flat; RoHS Compliant: Yes; LCSC Part Number: C106204
C70 = UUD1A102MNL1GS: CAP ALUM 1000UF 20% 10V SMD; Manufacturer: Nichicon; Dielectric Material: Aluminium; Ripple Current: 670mA; Impedance: 90mR; Value: 1mF; Leakage Current: 3uA; Life (Hours): 5000Hour; Dissipation Factor: 0.24%; Lead Diameter: 1.1mm; Item Type: Capacitor; Supplier 1: Arrow Electronics; Manufacturer Part Number: UUD1A102MNL1GS; RoHS: Yes; Category: Aluminum Electrolytic Capacitors; Stock 1: 26500; Pricing 1: 500=0.33690, 1000=0.29090, 2500=0.27810, 5000=0.26240, 12500=0.24280, 25000=0.24040 (USD); Case/Package: Radial; Pins: 2; Min Operating Temperature: -55°C; Max Operating Temperature: 105°C; Tolerance: 20%; Package Quantity: 1; Voltage Rating (DC): 10V; Ripple Current (AC): 670mA; Packaging: Tape and Reel; Voltage Rating: 10V; Termination: SMD/SMT; Voltage: 10V; Series: UD; Construction: Cylindrical; Diameter: 10mm; Length: 10mm; Height: 10mm; Lead Pitch: 4.5mm; Height - Seated (Max): 0.394inch; Radiation Hardening: No; Reach SVHC Compliant: Yes; Lead Free: Lead Free; RoHS Compliant: Yes; ComponentLink1URL: https://datasheet.ciiva.com/98/e-ud-98263.pdf?src-supplier=Digi-Key; ComponentLink1Description: https://datasheet.ciiva.com/98/e-ud-98263.pdf?src-supplier=Digi-Key; ComponentLink2URL: https://datasheet.ciiva.com/16502/e-ud-16502759.pdf?src-supplier=Future+Electronics; ComponentLink2Description: https://datasheet.ciiva.com/16502/e-ud-16502759.pdf?src-supplier=Future+Electronics; ComponentLink3URL: https://datasheet.ciiva.com/98/e-ud-98264.pdf?src-supplier=Digi-Key; ComponentLink3Description: https://datasheet.ciiva.com/98/e-ud-98264.pdf?src-supplier=Digi-Key; ComponentLink4URL: https://datasheet.ciiva.com/28458/e-ud-28458024.pdf?src-supplier=Element14; ComponentLink4Description: https://datasheet.ciiva.com/28458/e-ud-28458024.pdf?src-supplier=Element14; ComponentLink5URL: https://datasheet.ciiva.com/98/e-ud-98265.pdf?src-supplier=Digi-Key; ComponentLink5Description: https://datasheet.ciiva.com/98/e-ud-98265.pdf?src-supplier=Digi-Key; ComponentLink6URL: https://datasheet.ciiva.com/7793/66055-7793131.pdf?src-supplier=Element14; ComponentLink6Description: https://datasheet.ciiva.com/7793/66055-7793131.pdf?src-supplier=Element14; ComponentLink7URL: https://datasheet.ciiva.com/22693/66055-22693549.pdf?src-supplier=Element14; ComponentLink7Description: https://datasheet.ciiva.com/22693/66055-22693549.pdf?src-supplier=Element14; Supplier Part Number 1: UUD1A102MNL1GS; LCSC Part Number: C445277
C71 = CC0402KRX5R7BB105: CAP CER 1UF 16V X5R 0402; Manufacturer: Yageo; Tolerance: 10%; Item Type: Capacitor; Supplier 1: Digi-Key; Manufacturer Part Number: CC0402KRX5R7BB105; Stock 1: 1405667; Pricing 1: 1=0.36, 10=0.252, 100=0.1512, 500=0.1134, 1000=0.09576, 2500=0.09072, 5000=0.08568 (USD); Mount: Surface Mount; Case/Package: 0402; Weight: 2.3E-05oz; Case Code (Imperial): 0402; Case Code (Metric): 1005; Min Operating Temperature: -55°C; Max Operating Temperature: 85°C; Capacitance: 1uF; Dielectric: X5R; Packaging: Tape and Reel; Voltage Rating (DC): 16V; Voltage Rating: 16V; Termination: SMD/SMT; Composition: Ceramic; Length: 1mm; Height: 0.5mm; Width: 0.02inch; Thickness: 0.022inch; Depth: 0.5mm; Radiation Hardening: No; Lead Free: Lead Free; Halogen Free: Halogen Free; ComponentLink1URL: http://www.yageo.com/documents/recent/UPY-GPHC_X5R_4V-to-50V_12.pdf?src-supplier=Avnet+Europe; ComponentLink1Description: http://www.yageo.com/documents/recent/UPY-GPHC_X5R_4V-to-50V_12.pdf?src-supplier=Avnet+Europe; Supplier Part Number 1: 311-1691-6-ND; LCSC Part Number: C325464
C72 = CC0603KRX5R7BB106: CAP CER 10UF 16V X5R 0603; Manufacturer: Yageo; Item Type: Capacitor; Tolerance: 10%; Manufacturer Part Number: CC0603KRX5R7BB106; LCSC Part Number: C2936601; ComponentLink1Description: http://www.yageo.com/documents/recent/UPY-GPHC_X5R_4V-to-50V_25.pdf?src-supplier=Digi-Key; ComponentLink1URL: http://www.yageo.com/documents/recent/UPY-GPHC_X5R_4V-to-50V_25.pdf?src-supplier=Digi-Key; Supplier 1: Digi-Key; RoHS: Yes; Category: Ceramic Capacitors; Stock 1: 240725; Pricing 1: 1=0.68000, 10=0.48000, 50=0.36300, 100=0.31610, 500=0.23416, 1000=0.19903 (USD); Mount: Surface Mount; Case/Package: 0603; Case Code (Imperial): 0603; Case Code (Metric): 1608; Min Operating Temperature: -55°C; Max Operating Temperature: 85°C; Packaging: Cut Tape; Capacitance: 10uF; Voltage Rating: 16V; RoHS Compliant: Yes; Supplier Part Number 1: 311-3486-1-ND
D31 = 1N4007- SMD: 1A Single 1kV 1.1V@1A SMA(DO-214AC) Diodes - General Purpose ROHS; Manufacturer: TWGMC; Manufacturer Part Number: 1N4007; Item Type: Diode; Package: SMA(DO-214AC); LCSC Part Number: C727081; ComponentLink1Description: LCSC; ComponentLink1URL: https://www.lcsc.com/product-detail/Diodes-General-Purpose_TWGMC-1N4007_C727081.html
J15 = BWSMA-KE-Z001: 1 Inner Bore SMA Board Side Positive Pin -65℃~+165℃ 50Ω Through Hole Coaxial Connector (RF) Assemblies RoHS; Manufacturer: BAT WIRELESS; Manufacturer Part Number: BWSMA-KE-Z001; Package: Custom; LCSC Part Number: C496549; Item Type: Connector; ComponentLink1Description: LCSC; ComponentLink1URL: https://www.lcsc.com/product-detail/C496549.html
R26 = RC0402JR-071KL: RES 1K OHM 5% 1/16W 0402; Manufacturer: Yageo; Resistance: 1kR; Power Rating: 62.5mW; Voltage Rating: 50V; Temperature Coefficient: 100ppm/°C; Max Power Dissipation: 63mW; Item Type: Resistor; Supplier 1: Digi-Key; Manufacturer Part Number: RC0402JR-071KL; RoHS: Yes; Category: Chip SMD Resistors; Stock 1: 452315; Pricing 1: 1=0.10000, 10=0.01300, 100=0.00540, 1000=0.00244, 2500=0.00212, 5000=0.00175 (USD); Case/Package: 0402; Case Code (Imperial): 0402; Case Code (Metric): 1005; Size Code: 0402; Min Operating Temperature: -55°C; Max Operating Temperature: 155°C; Tolerance: 5%; Packaging: Tape and Reel; Package Quantity: 1; Termination: SMD/SMT; Resistor Type: Thick Film; Number of Terminations: 2; Features: Moisture Resistant; Series: RC; Resistance Tolerance: 5%; Construction: Rectangular; Length: 0.039inch; Width: 0.02inch; Height: 0.016inch; Depth: 0.5mm; REACH SVHC: No SVHC; Military Standard: Not; Lead Free: Lead Free; RoHS Compliant: Yes; ComponentLink1URL: https://datasheet.ciiva.com/7983/1018594-7983558.pdf?src-supplier=Element14; ComponentLink1Description: https://datasheet.ciiva.com/7983/1018594-7983558.pdf?src-supplier=Element14; ComponentLink2URL: https://datasheet.ciiva.com/2452/pyu-r-int-thick-7-2452756.pdf?src-supplier=Digi-Key; ComponentLink2Description: https://datasheet.ciiva.com/2452/pyu-r-int-thick-7-2452756.pdf?src-supplier=Digi-Key; ComponentLink3URL: https://datasheet.ciiva.com/2452/pyu-r-int-thick-7-2452757.pdf?src-supplier=Digi-Key; ComponentLink3Description: https://datasheet.ciiva.com/2452/pyu-r-int-thick-7-2452757.pdf?src-supplier=Digi-Key; ComponentLink4URL: https://datasheet.ciiva.com/2452/pyu-r-int-thick-7-2452755.pdf?src-supplier=Digi-Key; ComponentLink4Description: https://datasheet.ciiva.com/2452/pyu-r-int-thick-7-2452755.pdf?src-supplier=Digi-Key; ComponentLink5URL: https://datasheet.ciiva.com/7850/1018594-7850170.pdf?src-supplier=Element14; ComponentLink5Description: https://datasheet.ciiva.com/7850/1018594-7850170.pdf?src-supplier=Element14; ComponentLink6URL: https://datasheet.ciiva.com/7850/1018594-7850171.pdf?src-supplier=Element14; ComponentLink6Description: https://datasheet.ciiva.com/7850/1018594-7850171.pdf?src-supplier=Element14; ComponentLink7URL: https://datasheet.ciiva.com/17081/pyu-rc0402-51-rohs-l-6-r-17081438.pdf?src-supplier=Future+Electronics; ComponentLink7Description: https://datasheet.ciiva.com/17081/pyu-rc0402-51-rohs-l-6-r-17081438.pdf?src-supplier=Future+Electronics; Supplier Part Number 1: 311-1.0KJRCT-ND; LCSC Part Number: C105637
R27-R29 R33 R40 R41 = RC0603JR-070RL: as R66 on sheet Voltage_Monitoring_Section; Supplier 1: Digi-Key; Manufacturer Part Number: RC0603JR-070RL; RoHS: Yes; Category: Chip SMD Resistors; Stock 1: 18081776; Pricing 1: 1=0.10000, 10=0.01700, 25=0.01240, 50=0.00960, 100=0.00700, 250=0.00536, 500=0.00430, 1000=0.00316 (USD); Case/Package: 0603; Number of Pins: 2; Contact Plating: Tin,Matte; Case Code (Imperial): 0603; Case Code (Metric): 1608; Size Code: 0603; Min Operating Temperature: -55°C; Max Operating Temperature: 155°C; Resistor Type: Thick Film; Packaging: Tape and Reel; Termination: SMD/SMT; Series: RC; Technology: THICK FILM; Package Quantity: 5000; Voltage Rating: 50V; Features: Moisture Resistant; Max Power Dissipation: 100mW; Number of Terminations: 2; Construction: Rectangular; Length: 1.6mm; Width: 0.8mm; Height: 0.45mm; Depth: 0.8mm; Radiation Hardening: No; Reach SVHC Compliant: No SVHC; Lead Free: Lead Free; RoHS Compliant: Yes; Military Standard: Not; Supplier Part Number 1: 311-0.0GRCT-ND; LCSC Part Number: C95177
R54 = AT0603BRD0713K7L: RES SMD 13.7KOHM 0.1% 1/10W 0603; Manufacturer: Yageo; Value: 13.7kR; Max Power Dissipation: 100mW; Temperature Coefficient: 25ppm/°C; Item Type: Resistor; Supplier: Mouser; Supplier Part Number: 603-AT0603BRD0713K7L; Manufacturer Part Number: AT0603BRD0713K7L; RoHS: Yes; Category: Chip SMD Resistors; Stock: 2500; Pricing: 1=0.52, 10=0.396, 50=0.396, 100=0.167, 1000=0.092, 10000=0.075 (USD); Case/Package: 0603; Min Operating Temperature: -55°C; Max Operating Temperature: 155°C; Packaging: Tape and Reel; Number of Terminations: 2; Tolerance: 0.1%; Features: Moisture Resistant,Automotive AEC-Q200,Anti-Sulfur; Series: AT; Length: 0.063inch; Width: 0.032inch; Height: 0.022inch; RoHS Compliant: Yes; ComponentLink1URL: http://www.yageo.com/documents/recent/PYu-AT_51_RoHS_L-3.pdf?src-supplier=Digi-Key; ComponentLink1Description: http://www.yageo.com/documents/recent/PYu-AT_51_RoHS_L-3.pdf?src-supplier=Digi-Key; LCSC Part Number: C855608
R170 = RC0402FR-0710KL: RES 10K OHM 1% 1/16W 0402; Manufacturer: Yageo; Max Power Dissipation: 63mW; Temperature Coefficient: 100ppm/°C; Resistance: 10kR; Voltage Rating (DC): 50V; Power Rating: 62.5mW; Item Type: Resistor; Manufacturer Part Number: RC0402FR-0710KL; RoHS: Yes; Category: Chip SMD Resistors; Case/Package: 0402; Case Code (Imperial): 0402; Case Code (Metric): 1005; Min Operating Temperature: -55°C; Max Operating Temperature: 155°C; Features: Moisture Resistant; Packaging: Tape and Reel; Tolerance: 1%; Number of Terminations: 2; Series: RC; RoHS Compliant: Yes; ComponentLink1URL: https://datasheet.ciiva.com/7660/38568-7660787.pdf?src-supplier=Element14; ComponentLink1Description: https://datasheet.ciiva.com/7660/38568-7660787.pdf?src-supplier=Element14; Supplier 1: Mouser; Stock 1: 18648329; Pricing 1: 1=0.10000, 10=0.01400, 50=0.01400, 100=0.00500, 1000=0.00300, 10000=0.00200 (USD); Number of Pins: 2; Resistor Type: Thick Film; Voltage Rating: 50V; Termination: SMD/SMT; Resistance Tolerance: 1%; Construction: Rectangular; Length: 1mm; Width: 0.5mm; Height: 0.32mm; Depth: 0.5mm; Lead Pitch: 0.2mm; REACH SVHC: No SVHC; Lead Free: Lead Free; Military Standard: Not; ComponentLink2URL: https://datasheet.ciiva.com/7849/1686128-7849814.pdf?src-supplier=Element14; ComponentLink2Description: https://datasheet.ciiva.com/7849/1686128-7849814.pdf?src-supplier=Element14; ComponentLink3URL: https://datasheet.ciiva.com/7983/1018594-7983486.pdf?src-supplier=Element14; ComponentLink3Description: https://datasheet.ciiva.com/7983/1018594-7983486.pdf?src-supplier=Element14; ComponentLink4URL: https://datasheet.ciiva.com/22747/1018594-22747512.pdf?src-supplier=Element14; ComponentLink4Description: https://datasheet.ciiva.com/22747/1018594-22747512.pdf?src-supplier=Element14; ComponentLink5URL: https://datasheet.ciiva.com/12667/pyu-rc0402-51-rohs-l-6-r-12667067.pdf?src-supplier=Mouser; ComponentLink5Description: https://datasheet.ciiva.com/12667/pyu-rc0402-51-rohs-l-6-r-12667067.pdf?src-supplier=Mouser; ComponentLink6URL: https://datasheet.ciiva.com/7849/1784430-7849813.pdf?src-supplier=Element14; ComponentLink6Description: https://datasheet.ciiva.com/7849/1784430-7849813.pdf?src-supplier=Element14; Supplier Part Number 1: 603-RC0402FR-0710KL; LCSC Part Number: C60490; Working Voltage: 50V; ComponentLink7URL: https://datasheet.ciiva.com/7849/1784430-7849815.pdf?src-supplier=Element14; ComponentLink7Description: https://datasheet.ciiva.com/7849/1784430-7849815.pdf?src-supplier=Element14
U28 = HC-12 SMD: HC12 Si4463 433MHZ RF Wireless Serial Module; Manufacturer Part Number: HC-12; Package: Custom; Item Type: Module
U29 = SY6280AAC: SOT-23-5 Power Distribution Switches ROHS; Manufacturer: Silergy; Item Type: IC; Supplier: Avnet; Supplier Part Number: SY6280AAC; Manufacturer Part Number: SY6280AAC; RoHS: No; Category: USB Interface ICs; Stock: 3000; LCSC Part Number: C55136